# Altium project AcquisitionBoard_EEG_Rev3.PrjPcb
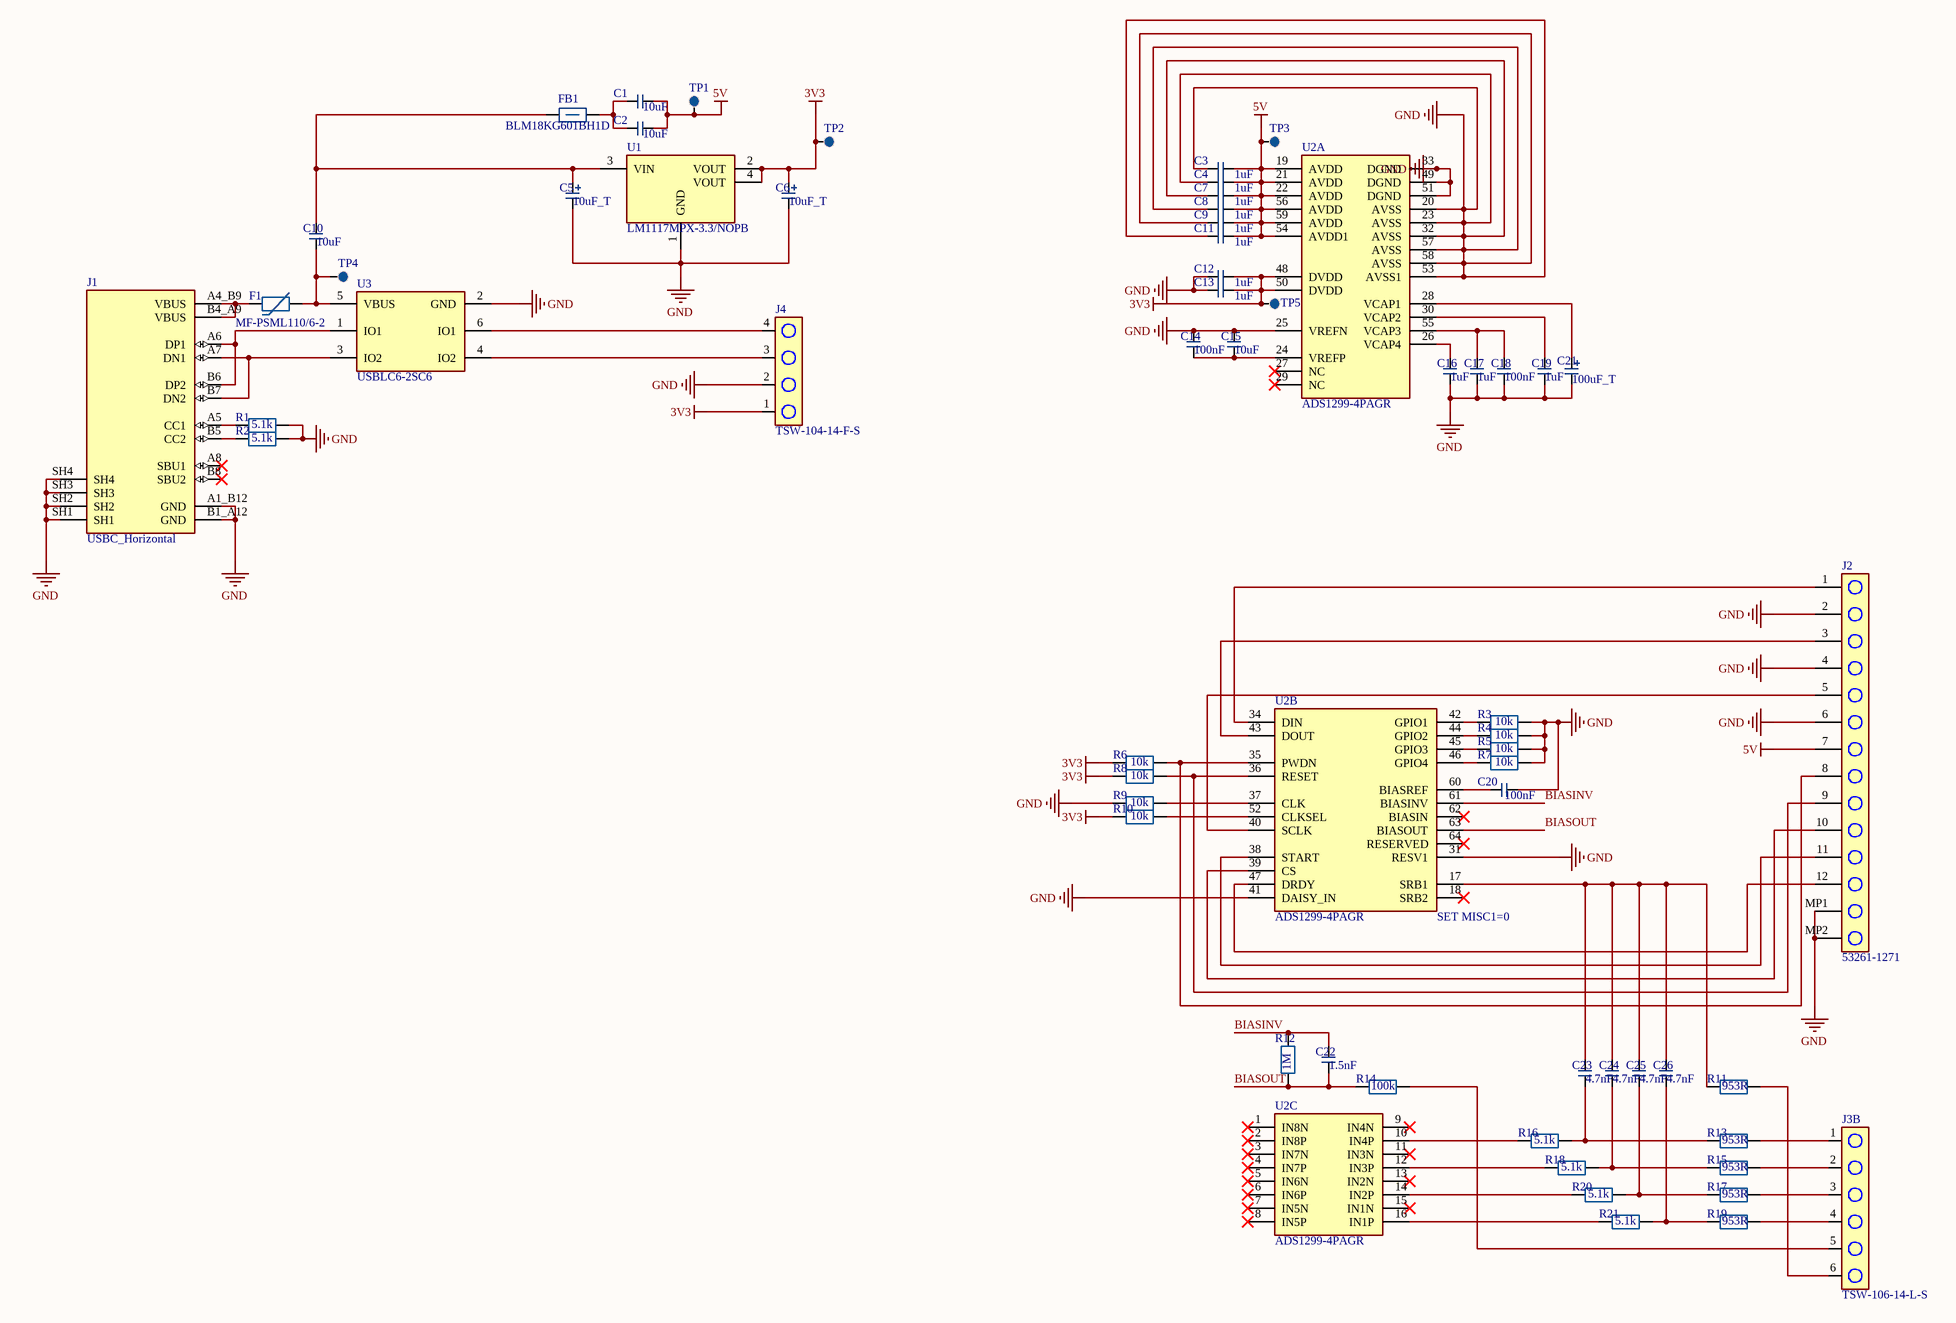
[diagram p0: Sheet1.SchDoc]
1 sheet, 61 parts. Net scope: global (net labels, ports and power ports of the same name join across sheets).
Board files: PCB1.PcbDoc, PCB2.PcbDoc

## Sheet Sheet1.SchDoc: EEG Acquisition Schematic
size A2; Author: Aushadh Subramanian; Organization: Cortex Dynamatics; Revision: A3; SheetNumber: 1; SheetTotal: 1

### Parts
C1  10uF  [CAP0402]
C2  10uF  [CAP0402]
C3  1uF  [CAP0402]
C4  1uF  [CAP0402]
C5  10uF_T  [CAP_TANTALUM_1206]
C6  10uF_T  [CAP_TANTALUM_1206]
C7  1uF  [CAP0402]
C8  1uF  [CAP0402]
C9  1uF  [CAP0402]
C10  10uF  [CAP0402]
C11  1uF  [CAP0402]
C12  1uF  [CAP0402]
C13  1uF  [CAP0402]
C14  100nF  [CAP0402]
C15  10uF  [CAP0402]
C16  1uF  [CAP0402]
C17  1uF  [CAP0402]
C18  100nF  [CAP0402]
C19  1uF  [CAP0402]
C20  100nF  [CAP0402]
C21  100uF_T  [CAP_TANTALUM_2917]
C22  1.5nF  [CAP0402]
C23  4.7nF  [CAP0402]
C24  4.7nF  [CAP0402]
C25  4.7nF  [CAP0402]
C26  4.7nF  [CAP0402]
F1  MF-PSML110/6-2  [MF-PSML110/6-2]
FB1  BLM18KG601BH1D  [FB_0603]
J1  USBC_Horizontal  [USBC_Horizontal]
J2  53261-1271  [53261-1271]
J3  TSW-106-14-L-S  [TSW-106-14-L-S]  (part B of 2)
J4  TSW-104-14-F-S  [TSW-104-14-F-S]
R1  5.1k  [RES0402]
R2  5.1k  [RES0402]
R3  10k  [RES0402]
R4  10k  [RES0402]
R5  10k  [RES0402]
R6  10k  [RES0402]
R7  10k  [RES0402]
R8  10k  [RES0402]
R9  10k  [RES0402]
R10  10k  [RES0402]
R11  953R  [RES_0402]
R12  1M  [RES0402]
R13  953R  [RES_0402]
R14  100k  [RES0402]
R15  953R  [RES_0402]
R16  5.1k  [RES0402]
R17  953R  [RES_0402]
R18  5.1k  [RES0402]
R19  953R  [RES_0402]
R20  5.1k  [RES0402]
R21  5.1k  [RES0402]
TP1  (no value)  [TestPoint_0.4mm_SMD]  (no BOM)
TP2  (no value)  [TestPoint_0.4mm_SMD]  (no BOM)
TP3  (no value)  [TestPoint_0.4mm_SMD]  (no BOM)
TP4  (no value)  [TestPoint_0.4mm_SMD]  (no BOM)
TP5  (no value)  [TestPoint_0.4mm_SMD]  (no BOM)
U1  LM1117MPX-3.3/NOPB  [LM1117MPX-3.3/NOPB]
U2  ADS1299-4PAGR  [ADS1299-4PAGR]  (parts A,B,C of 3)
U3  USBLC6-2SC6  [USBLC6-2SC6]

### Nets
3V3: C6.1 C12.2 C13.2 J4.1 R6.1 R8.1 R10.1 TP2.1 TP5.1 U1.2(VOUT) U1.4(VOUT) U2.48(DVDD) U2.50(DVDD)
5V: C1.1 C2.1 C3.2 C4.2 C7.2 C8.2 C9.2 C11.2 J2.7 TP1.1 TP3.1 U2.19(AVDD) U2.21(AVDD) U2.22(AVDD) U2.54(AVDD1) U2.56(AVDD) U2.59(AVDD)
GND: C3.1 C4.1 C5.2 C6.2 C7.1 C8.1 C9.1 C11.1 C12.1 C13.1 C14.2 C15.1 C16.1 C17.1 C18.1 C19.1 C20.1 C21.2 J1.A1_B12(GND) J1.B1_A12(GND) J1.SH1 J1.SH2 J1.SH3 J1.SH4 J2.2 J2.4 J2.6 J2.MP1 J2.MP2 J4.2 R1.2 R2.2 R3.2 R4.2 R5.2 R7.2 R9.1 U1.1(GND) U2.20(AVSS) U2.23(AVSS) U2.25(VREFN) U2.31(RESV1) U2.32(AVSS) U2.33(DGND) U2.41(DAISY_IN) U2.49(DGND) U2.51(DGND) U2.53(AVSS1) U2.57(AVSS) U2.58(AVSS) U3.2(GND)
BIASINV: C22.2 R12.2 U2.61(BIASINV)
BIASOUT: C22.1 R12.1 R14.1 U2.63(BIASOUT)
NetC1_2: C1.2 C2.2 FB1.2
NetC5_1: C5.1 C10.2 FB1.1 U1.3(VIN)
NetC10_1: C10.1 F1.2 TP4.1 U3.5(VBUS)
NetC14_1: C14.1 C15.2 U2.24(VREFP)
NetC16_2: C16.2 U2.26(VCAP4)
NetC17_2: C17.2 C18.2 U2.55(VCAP3)
NetC19_2: C19.2 U2.30(VCAP2)
NetC20_2: C20.2 U2.60(BIASREF)
NetC21_1: C21.1 U2.28(VCAP1)
NetC23_1: C23.1 R13.1 R16.2
NetC23_2: C23.2 C24.2 C25.2 C26.2 R11.1 U2.17(SRB1)
NetC24_1: C24.1 R15.1 R18.2
NetC25_1: C25.1 R17.1 R20.2
NetC26_1: C26.1 R19.1 R21.2
NetF1_1: F1.1 J1.A4_B9(VBUS) J1.B4_A9(VBUS)
NetJ1_A5: J1.A5(CC1) R1.1
NetJ1_A6: J1.A6(DP1) J1.B6(DP2) U3.1(IO1)
NetJ1_A7: J1.A7(DN1) J1.B7(DN2) U3.3(IO2)
NetJ1_B5: J1.B5(CC2) R2.1
NetJ2_1: J2.1 U2.34(DIN)
NetJ2_3: J2.3 U2.43(DOUT)
NetJ2_5: J2.5 U2.40(SCLK)
NetJ2_8: J2.8 R6.2 U2.35(PWDN)
NetJ2_9: J2.9 R8.2 U2.36(RESET)
NetJ2_10: J2.10 U2.39(CS)
NetJ2_11: J2.11 U2.38(START)
NetJ2_12: J2.12 U2.47(DRDY)
NetJ3_1: J3.1 R13.2
NetJ3_2: J3.2 R15.2
NetJ3_3: J3.3 R17.2
NetJ3_4: J3.4 R19.2
NetJ3_5: J3.5 R14.2
NetJ3_6: J3.6 R11.2
NetJ4_3: J4.3 U3.4(IO2)
NetJ4_4: J4.4 U3.6(IO1)
NetR3_1: R3.1 U2.42(GPIO1)
NetR4_1: R4.1 U2.44(GPIO2)
NetR5_1: R5.1 U2.45(GPIO3)
NetR7_1: R7.1 U2.46(GPIO4)
NetR9_2: R9.2 U2.37(CLK)
NetR10_2: R10.2 U2.52(CLKSEL)
NetR16_1: R16.1 U2.10(IN4P)
NetR18_1: R18.1 U2.12(IN3P)
NetR20_1: R20.1 U2.14(IN2P)
NetR21_1: R21.1 U2.16(IN1P)

Not connected (* = marked no-connect by the designer): J1 A8(SBU1)* B8(SBU2)*; U2 1(IN8N)* 2(IN8P)* 3(IN7N)* 4(IN7P)* 5(IN6N)* 6(IN6P)* 7(IN5N)* 8(IN5P)* 9(IN4N)* 11(IN3N)* 13(IN2N)* 15(IN1N)* 18(SRB2)* 27(NC)* 29(NC)* 62(BIASIN)* 64(RESERVED)*

### Notes on the sheet
- (near U2) SET MISC1=0

### Library data of the parts
C1 C2 C10 C15 = 119: CAP 10uF 10% 0402 10V X5R; Manufacturer: Yageo; MPN: CC0402KRX5R6BB106; ID: 119; Package Imperial: 0402; Package Metric: 1005; Capacitance: 10uF; Tolerance: 10%; Dielectric: X5R; Voltage Rating: 10V; Mouser PN: 603-CC0402KRX5R6BB106; Datasheet: https://www.farnell.com/datasheets/3990005.pdf
C3 C4 C7-C9 C11-C13 C16 C17 C19 = 115: CAP 1uF 10% 0402 10V X5R; Manufacturer: Yageo; MPN: CC0402KRX5R6BB105; ID: 115; Package Imperial: 0402; Package Metric: 1005; Capacitance: 1uF; Tolerance: 10%; Dielectric: X5R; Voltage Rating: 10V; Mouser PN: 603-CC0402KRX5R6BB105; Digikey PN: 311-1439-1-ND; Datasheet: https://www.farnell.com/datasheets/3990005.pdf
C5 C6 = C_10u_1206_TANTALUM: 10 uF 10% 1206 Tantalum Capacitor; Manufacturer: Yageo (KEMET); Manufacturer Part Number: T491A106K006AT; Value: 10 uF; Package (Imperial): 1206; Voltage Rating DC: 6.3 VDC; Tolerance: 10%; Dielectric: Tantalum; ComponentLink1Description: Datasheet; ComponentLink1URL: https://yageogroup.com/component-documentation/download/datasheet/T491A106K006AT?lang=en; Supplier 1: Mouser; Supplier Part Number 1: 80-T491A106K006
C14 C18 C20 = 112: CAP 100nF 10% 0402 16V X7R; Manufacturer: Yageo; MPN: CC0402KRX7R7BB104; ID: 112; Package Imperial: 0402; Package Metric: 1005; Capacitance: 100nF; Tolerance: 10%; Dielectric: X7R; Voltage Rating: 16V; Mouser PN: 603-CC0402KRX7R7BB104; Digikey PN: 311-1081-1-ND; Datasheet: https://yageogroup.com/content/datasheet/asset/file/UPY-GPHC_X7R_6_3V-TO-250V
C21 = C_100u_2817_TANTALUM: 100 uF 10% 2817 Tantalum capacitor; Manufacturer: Yageo (KEMET); Manufacturer Part Number: T495D107K016ATE100; Value: 100 uF; Package (Imperial): 2817; Voltage Rating DC: 16 VDC; Tolerance: 10%; Dielectric: Tantalum; Datasheet: https://yageogroup.com/component-documentation/download/datasheet/T495D107K016ATE100?lang=en
C22 = 89: CAP 1.5nF 5% 0402 50V NP0; Manufacturer: Yageo; MPN: CC0402JRNPO9BN152; ID: 89; Package Imperial: 0402; Package Metric: 1005; Capacitance: 1.5nF; Tolerance: 5%; Dielectric: NP0; Voltage Rating: 50V; Mouser PN: 603-CC0402JRNPO9BN152; Datasheet: https://www.mouser.com/datasheet/2/447/UPY_GP_NP0_16V_to_50V_18-1730511.pdf
C23-C26 = 102: CAP 4.7nF 10% 0402 50V X7R; Manufacturer: Yageo; MPN: CC0402KRX7R9BB472; ID: 102; Package Imperial: 0402; Package Metric: 1005; Capacitance: 4.7nF; Tolerance: 10%; Dielectric: X7R; Voltage Rating: 50V; Mouser PN: 603-CC0402KRX7R9BB472; Datasheet: https://yageogroup.com/content/datasheet/asset/file/UPY-GPHC_X7R_6_3V-TO-250V
F1 = MF-PSML110/6-2: PPTC 6V 1.1A; Manufacturer: Bourns; Package (Imperial): 0805; Trip Current: 2.2 A; Maximum Current: 50 A; Maximum Voltage: 6 VDC; Manufacturer Part Number: MF-PSML110/6-2; Hold Current: 1.1 A; Supplier 1: Mouser; Supplier Part Number 1: 652-MF-PSML110/6-2; Supplier 2: Newark; Supplier Part Number 2: MF-PSML110/6-2; Supplier 3: DigiKey; Supplier Part Number 3: 118-MF-PSML110/6-2CT-ND
FB1 = BLM18KG601BH1D: FB 600 Ohm 1 A; Manufacturer: Murata; Package (Imperial): 0603; Value: 600 Ohm; Tolerance: 25%; Maximum DC Current: 1 A; Manufacturer Part Number: BLM18KG601BH1D; Supplier 1: Mouser; Supplier Part Number 1: 81-BLM18KG601BH1D; Supplier 2: DigiKey; Supplier Part Number 2: 490-14032-1-ND
J1 = USBC_Horizontal: USB-C, USB-2.0 SMD 16 contacts, horizontal; Manufacturer: GCT; Manufacturer Part Number: USB4105GFA; Number of Contacts: 16; Current Rating: 5 A; Voltage Rating: 48 VDC; Standard: USB-2.0; Termination: SMD; Supplier 1: Mouser; Supplier Part Number 1: 640-USB4105-GF-A; Supplier 2: DigiKey; Supplier Part Number 2: 2073-USB4105-GF-ADKR-ND
J2 = 53261-1271: 1x12 Headers 2.54 Pitch; Manufacturer: Molex; Number of Positions: 12; Pitch: 2.54 mm; Manufacturer Part Number: 53261-1271; Number of Rows: 1; Supplier 1: Mouser; Supplier Part Number 1: 538-53261-1271; Supplier 2: DigiKey; Supplier Part Number 2: WM7630DKR-ND
J3 = TSW-106-14-L-S: 1x6 Headers 2.54 Pitch; Manufacturer: Samtec; Number of Positions: 6; Manufacturer Part Number: TSW-106-14-L-S; Number of Rows: 1; Pitch 2.54mm: *; Supplier 1: Mouser; Supplier Part Number 1: 200-TSW10614LS; Supplier 2: DigiKey; Supplier Part Number 2: 612-TSW-106-14-L-S-ND
J4 = TSW-104-14-F-S: 1x4 Headers 2.54 Pitch; Manufacturer: Samtec; Number of Positions: 4; Pitch: 2.54 mm; Supplier 1: Mouser; Supplier Part Number 1: 200-TSW10414FS; Supplier 2: DigiKey; Supplier Part Number 2: SAM15369-ND; Manufacturer Part Number: TSW-104-14-F-S; Number of Rows: 1
R1 R2 R16 R18 R20 R21 = 187: RES 5.1k 1% 0402 1/16W; Manufacturer: Yageo; MPN: RC0402FR-075K1L; ID: 187; Package Imperial: 0402; Package Metric: 1005; Voltage Rating: 50V; Resistance: 5.1k; Tolerance: 1%; Power Rating: 1/16W; Mouser PN: 603-RC0402FR-075K1L; Datasheet: https://yageogroup.com/content/datasheet/asset/file/PYU-RC_GROUP_51_ROHS_L
R3-R10 = 194: RES 10k 1% 0402 1/16W; Manufacturer: Yageo; MPN: RC0402FR-0710KL; ID: 194; Package Imperial: 0402; Package Metric: 1005; Voltage Rating: 50V; Resistance: 10k; Tolerance: 1%; Power Rating: 1/16W; Mouser PN: 603-RC0402FR-0710KL; Datasheet: https://yageogroup.com/content/datasheet/asset/file/PYU-RC_GROUP_51_ROHS_L
R11 R13 R15 R17 R19 = R_953R_0402: 953 Ohm 1% 0402 resistor; Manufacturer: Yageo; Manufacturer Part Number: RC0402FR-07953RL; Value: 953 Ohm; Package (Imperial): 0402; Power Rating: 0.063 W; Voltage Rating: 50 V; Tolerance: 1%; Supplier 1: Mouser; Supplier Part Number 1: 603-RC0402FR-07953RL; Supplier 2: Newark; Supplier Part Number 2: RC0402FR-07953RL; Supplier 3: DigiKey; Supplier Part Number 3: YAG3263DKR-ND; ComponentLink1Description: Datasheet; ComponentLink1URL: https://yageogroup.com/component-documentation/download/datasheet/RC0402FR-071K5L?lang=en
R12 = 242: RES 1M 1% 0402 1/16W; Manufacturer: Yageo; MPN: RC0402FR-071ML; ID: 242; Package Imperial: 0402; Package Metric: 1005; Voltage Rating: 50V; Resistance: 1M; Tolerance: 1%; Power Rating: 1/16W; Mouser PN: 603-RC0402FR-071ML; Datasheet: https://yageogroup.com/content/datasheet/asset/file/PYU-RC_GROUP_51_ROHS_L
R14 = 218: RES 100k 1% 0402 1/16W; Manufacturer: Yageo; MPN: RC0402FR-07100KL; ID: 218; Package Imperial: 0402; Package Metric: 1005; Voltage Rating: 50V; Resistance: 100k; Tolerance: 1%; Power Rating: 1/16W; Mouser PN: 603-RC0402FR-07100KL; Datasheet: https://yageogroup.com/content/datasheet/asset/file/PYU-RC_GROUP_51_ROHS_L
TP1-TP5 = TestPoint_0.4mm: SMD Testpoint. No component to be bought.
U1 = LM1117MPX-3.3/NOPB: Adjustable voltage regulator, 800mA, PMIC; Manufacturer: Texas Instruments; Topology: LDO; Input Voltage: 4.5V - 18V; Output Voltage: 3.3V Fixed; Manufacturer Part Number: LM1117MPX-3.3/NOPB; Package: SOT-223-4; Output Current: 800mA; ComponentLink1Description: Datasheet; ComponentLink1URL: https://www.ti.com/lit/gpn/lm1117; Supplier 1: Mouser; Supplier Part Number 1: 926-LM1117MPX3.3NOPB; Supplier 2: Texas Instruments; Supplier Part Number 2: LM1117MPX-3.3/NOPB; Supplier 3: DigiKey; Supplier Part Number 3: LM1117MPX-3.3/NOPBCT-ND; Supplier 4: Newark; Supplier Part Number 4: LM1117MPX-3.3/NOPB
U2 = ADS1299-4PAGR: 24-bit low-noise ADC, 4-channel EEG AFE; Manufacturer: Texas Instruments; Input Voltage: 1.8-5V; Manufacturer Part Number: ADS1299-4PAGR; Package: TQFP-64; Topology: -; Output Voltage: -; Output Current: -; Supplier 1: Mouser; Supplier Part Number 1: 595-ADS1299-4PAGR; Supplier 2: Texas Instruments; Supplier Part Number 2: ADS1299-4PAGR; Supplier 3: DigiKey; Supplier Part Number 3: 296-45228-6-ND; ComponentLink1Description: Datasheet; ComponentLink1URL: https://www.ti.com/lit/gpn/ads1299-4
U3 = USBLC6-2SC6: Dual-line ESD Surge Protector, 0.6 pF; Manufacturer: STMicroelectronics; Manufacturer Part Number: USBLC6-2SC6; Package: SOT-23-6; Topology: -; Input Voltage: -; Output Voltage: -; Output Current: -; Supplier 1: Mouser; Supplier Part Number 1: 511-USBLC6-2SC6; Supplier 2: DigiKey; Supplier Part Number 2: 497-5235-6-ND